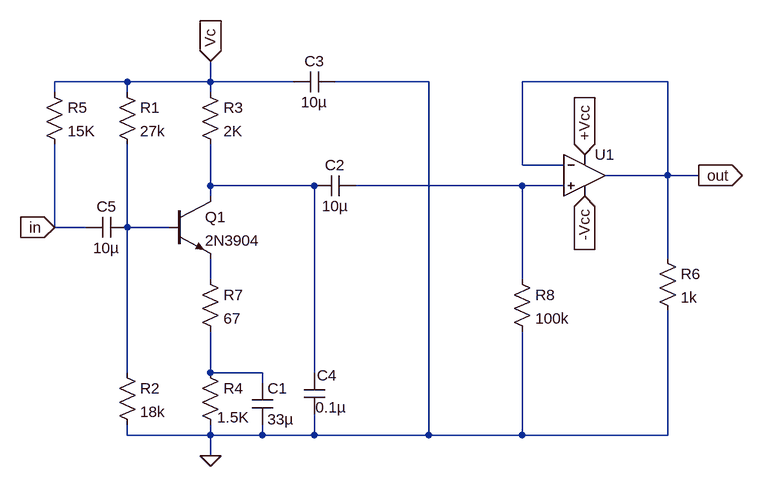
[diagram p0: schematic Pre_Amplifier.asc]
Pre_Amplifier.asc, the LTspice schematic file:
Version 4.1
SHEET 1 1172 680
WIRE 160 -80 48 -80
WIRE 288 -80 288 -112
WIRE 288 -80 160 -80
WIRE 416 -80 288 -80
WIRE 624 -80 480 -80
WIRE 992 -80 768 -80
WIRE 48 -64 48 -80
WIRE 160 -64 160 -80
WIRE 288 -64 288 -80
WIRE 768 48 768 -80
WIRE 832 48 768 48
WIRE 992 64 992 -80
WIRE 992 64 896 64
WIRE 1040 64 992 64
WIRE 288 80 288 16
WIRE 448 80 288 80
WIRE 768 80 512 80
WIRE 832 80 768 80
WIRE 288 96 288 80
WIRE 48 144 48 16
WIRE 96 144 48 144
WIRE 160 144 160 16
WIRE 160 144 144 144
WIRE 224 144 160 144
WIRE 992 192 992 64
WIRE 288 224 288 192
WIRE 768 224 768 80
WIRE 160 368 160 144
WIRE 288 368 288 304
WIRE 368 368 288 368
WIRE 448 368 448 80
WIRE 368 384 368 368
WIRE 160 464 160 448
WIRE 288 464 288 448
WIRE 288 464 160 464
WIRE 368 464 368 448
WIRE 368 464 288 464
WIRE 448 464 448 432
WIRE 448 464 368 464
WIRE 624 464 624 -80
WIRE 624 464 448 464
WIRE 768 464 768 304
WIRE 768 464 624 464
WIRE 992 464 992 272
WIRE 992 464 768 464
WIRE 288 496 288 464
FLAG 288 496 0
FLAG 864 32 +Vcc
IOPIN 864 32 In
FLAG 864 96 -Vcc
IOPIN 864 96 In
FLAG 288 -112 Vc
IOPIN 288 -112 In
FLAG 48 144 in
IOPIN 48 144 In
FLAG 1040 64 out
IOPIN 1040 64 Out
SYMBOL res 144 -80 R0
SYMATTR InstName R1
SYMATTR Value 27k
SYMBOL res 144 352 R0
SYMATTR InstName R2
SYMATTR Value 18k
SYMBOL res 272 -80 R0
SYMATTR InstName R3
SYMATTR Value 2K
SYMATTR SpiceLine tol=1 pwr=0.1
SYMBOL res 272 352 R0
WINDOW 3 26 85 Left 2
SYMATTR Value 1.5K
SYMATTR InstName R4
SYMATTR SpiceLine tol=1 pwr=0.1
SYMBOL res 32 -80 R0
SYMATTR InstName R5
SYMATTR Value 15K
SYMATTR SpiceLine tol=1 pwr=0.1
SYMBOL npn 224 96 R0
SYMATTR InstName Q1
SYMATTR Value 2N3904
SYMBOL cap 352 384 R0
SYMATTR InstName C1
SYMATTR Value 33µ
SYMATTR SpiceLine V=2.5 Irms=790m Rser=0.18 Lser=0 mfg="Vishay" pn="T55A336M2R5" type="Tantalum Polymer"
SYMBOL cap 512 64 R90
WINDOW 0 0 32 VBottom 2
WINDOW 3 32 32 VTop 2
SYMATTR InstName C2
SYMATTR Value 10µ
SYMATTR SpiceLine V=2.5 Irms=0 Rser=0 Lser=0 mfg="Murata" pn="GRM155R60E106ME16" type="X5R"
SYMBOL cap 416 -64 R270
WINDOW 0 32 32 VTop 2
WINDOW 3 0 32 VBottom 2
SYMATTR InstName C3
SYMATTR Value 10µ
SYMATTR SpiceLine V=2.5 Irms=0 Rser=0 Lser=0 mfg="Murata" pn="GRM155R60E106ME16" type="X5R"
SYMBOL cap 464 432 R180
WINDOW 0 -19 60 Left 2
WINDOW 3 -33 11 Left 2
SYMATTR InstName C4
SYMATTR Value 0.1µ
SYMATTR SpiceLine V=4 Irms=0 Rser=0 Lser=0 mfg="Murata" pn="GRM011R60G103KE01" type="X5R"
SYMBOL cap 160 128 R90
WINDOW 0 0 32 VBottom 2
WINDOW 3 32 32 VTop 2
SYMATTR InstName C5
SYMATTR Value 10µ
SYMATTR SpiceLine V=2.5 Irms=0 Rser=0 Lser=0 mfg="Murata" pn="GRM155R60E106ME16" type="X5R"
SYMBOL res 272 208 R0
SYMATTR InstName R7
SYMATTR Value 67
SYMBOL OpAmps\\UniversalOpAmp 864 64 R0
SYMATTR InstName U1
SYMBOL res 976 176 R0
SYMATTR InstName R6
SYMATTR Value 1k
SYMBOL res 752 208 R0
SYMATTR InstName R8
SYMATTR Value 100k

The netlist it stands for:
* Pre_Amplifier.asc
R1 Vc N003 27k
R2 N003 0 18k
R3 Vc N001 2K tol=1 pwr=0.1
R4 N005 0 1.5K tol=1 pwr=0.1
R5 Vc in 15K tol=1 pwr=0.1
Q1 N001 N003 N004 0 2N3904
C1 N005 0 33µ V=2.5 Irms=790m Rser=0.18 Lser=0 mfg="Vishay" pn="T55A336M2R5" type="Tantalum Polymer"
C2 N002 N001 10µ V=2.5 Irms=0 Rser=0 Lser=0 mfg="Murata" pn="GRM155R60E106ME16" type="X5R"
C3 Vc 0 10µ V=2.5 Irms=0 Rser=0 Lser=0 mfg="Murata" pn="GRM155R60E106ME16" type="X5R"
C4 0 N001 0.1µ V=4 Irms=0 Rser=0 Lser=0 mfg="Murata" pn="GRM011R60G103KE01" type="X5R"
C5 N003 in 10µ V=2.5 Irms=0 Rser=0 Lser=0 mfg="Murata" pn="GRM155R60E106ME16" type="X5R"
R7 N004 N005 67
X§U1 N002 out +Vcc -Vcc out level1 Avol=1Meg GBW=10Meg Vos=0 En=0 Enk=0 In=0 Ink=0 Rin=500Meg  ; pins In+ In- V+ V- OUT
R6 out 0 1k
R8 N002 0 100k
.model NPN NPN
.model PNP PNP
.lib standard.bjt
.lib UniversalOpAmp1.lib
.backanno
.end